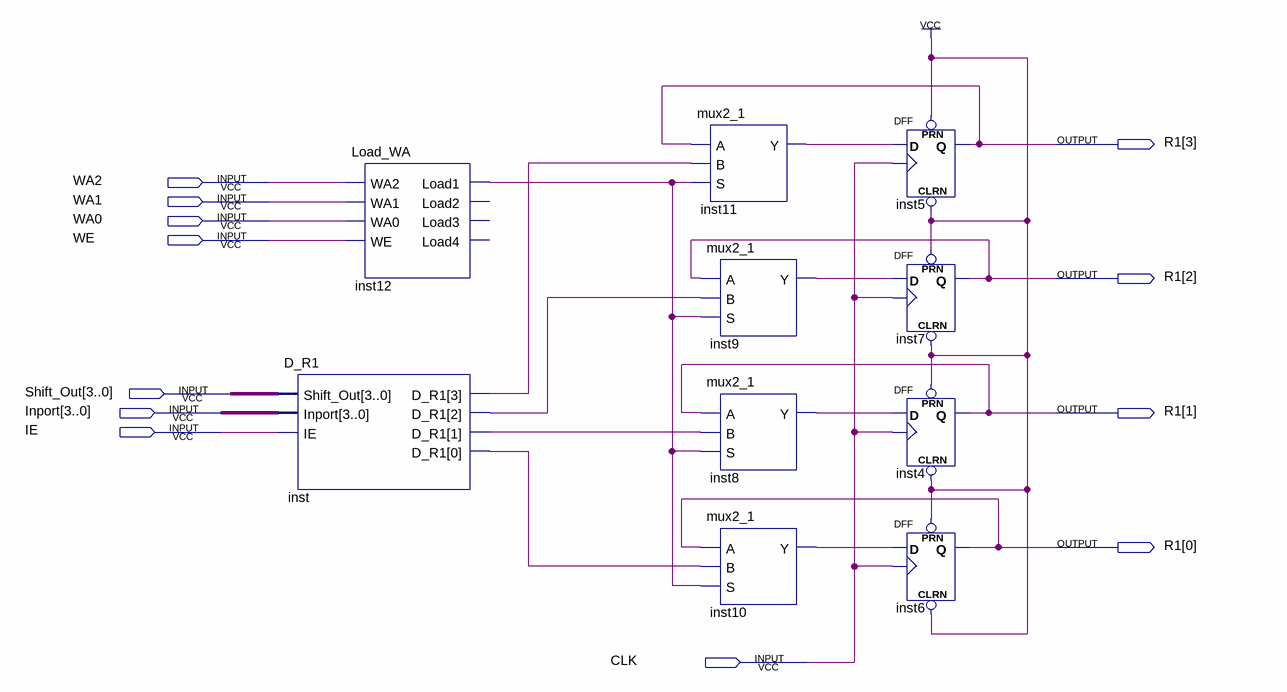
[diagram p0: schematic sheet]
// Quartus schematic R1_4bit.bdf as structural Verilog: 10 symbols, 12 pins
module R1_4bit (
  input  WA2,
  input  WA1,
  input  WA0,
  input  WE,
  input  [3:0] Shift_Out,
  input  [3:0] Inport,
  input  IE,
  input  CLK,
  output [3:0] R1
);

  wire inst8_y, inst9_y, inst10_y, inst11_y, inst12_load1, inst_d_r1, inst_d_r1_2, inst_d_r1_3, inst_d_r1_4;

  D_R1 inst (
    .Shift_Out(Shift_Out), .Inport(Inport), .IE(IE), .D_R1({inst_d_r1, inst_d_r1_2, inst_d_r1_3, inst_d_r1_4}));
  Load_WA inst12 (.WA2(WA2), .WA1(WA1), .WA0(WA0), .WE(WE), .Load1(inst12_load1));  // open: Load2, Load3, Load4
  mux2_1 inst11 (.A(R1[3]), .B(inst_d_r1), .S(inst12_load1), .Y(inst11_y));
  mux2_1 inst9 (.A(R1[2]), .B(inst_d_r1_2), .S(inst12_load1), .Y(inst9_y));
  mux2_1 inst8 (.A(R1[1]), .B(inst_d_r1_3), .S(inst12_load1), .Y(inst8_y));
  mux2_1 inst10 (.A(R1[0]), .B(inst_d_r1_4), .S(inst12_load1), .Y(inst10_y));
  DFF inst5 (.CLRN(1'b1), .CLK(CLK), .D(inst11_y), .PRN(1'b1), .Q(R1[3]));
  DFF inst7 (.CLRN(1'b1), .CLK(CLK), .D(inst9_y), .PRN(1'b1), .Q(R1[2]));
  DFF inst4 (.CLRN(1'b1), .CLK(CLK), .D(inst8_y), .PRN(1'b1), .Q(R1[1]));
  DFF inst6 (.CLRN(1'b1), .CLK(CLK), .D(inst10_y), .PRN(1'b1), .Q(R1[0]));
endmodule
